# Altium schematic sheet DXES101B-659637-GENERAL.SchDoc
size A3; Organization: Altium Limited; Address1: 3 Minna Close; Address2: Belrose; Address3: NSW 2085; Address4: Australia; SheetNumber: 1; SheetTotal: 10
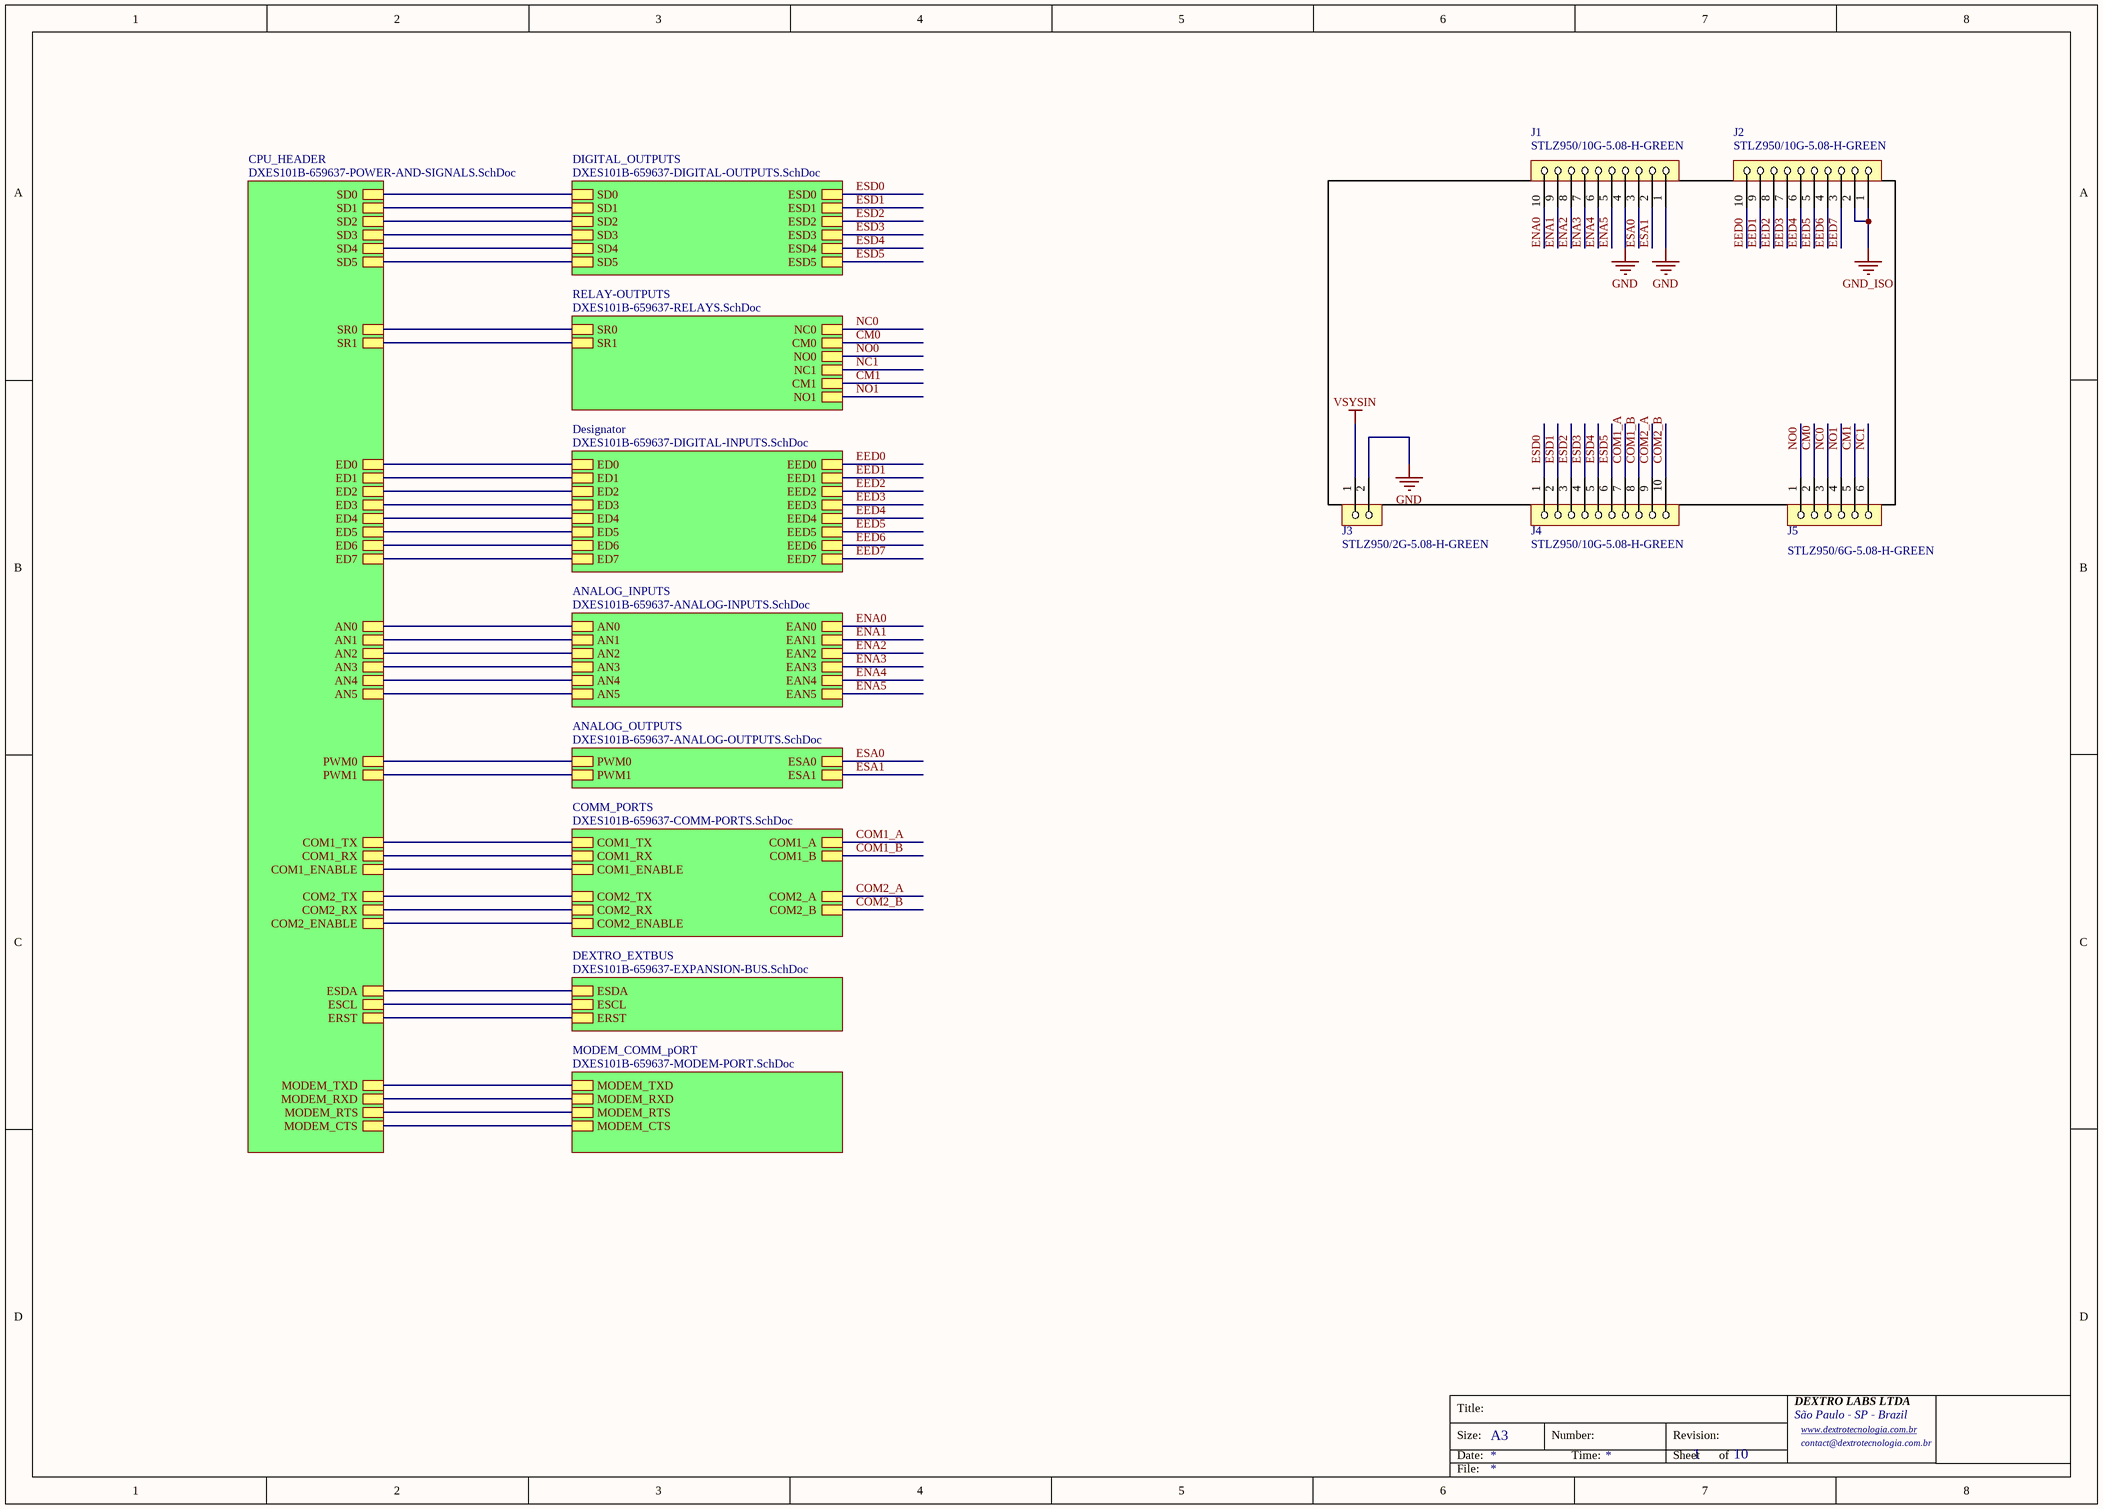
[diagram p0: DXES101B-659637-GENERAL.SchDoc]

## Parts
J1  STLZ950/10G-5.08-H-GREEN  [STLZ950-10G-H]
J2  STLZ950/10G-5.08-H-GREEN  [STLZ950-10G-H]
J3  STLZ950/2G-5.08-H-GREEN  [STLZ950-02G-H]
J4  STLZ950/10G-5.08-H-GREEN  [STLZ950-10G-H]
J5  STLZ950/6G-5.08-H-GREEN  [STLZ950-06G-H]

## Sub-sheets
ANALOG_INPUTS = DXES101B-659637-ANALOG-INPUTS.SchDoc: AN0, AN1, AN2, AN3, EAN0, EAN1, EAN2, EAN3, EAN4, EAN5, AN4, AN5
ANALOG_OUTPUTS = DXES101B-659637-ANALOG-OUTPUTS.SchDoc: PWM0, PWM1, ESA0, ESA1
COMM_PORTS = DXES101B-659637-COMM-PORTS.SchDoc: COM1_TX, COM1_RX, COM1_ENABLE, COM2_TX, COM2_RX, COM2_ENABLE, COM1_A, COM1_B, COM2_A, COM2_B
CPU_HEADER = DXES101B-659637-POWER-AND-SIGNALS.SchDoc: SD0, SD1, SD2, SD3, SD4, SD5, SR0, SR1, ED0, ED1, ED2, ED3, ED4, ED5, ED6, ED7, AN0, AN1, AN2, AN3, PWM0, PWM1, COM1_TX, COM1_RX, COM1_ENABLE, COM2_TX, COM2_RX, COM2_ENABLE, ESDA, ESCL, ERST, MODEM_TXD, MODEM_RXD, MODEM_RTS, MODEM_CTS, AN4, AN5
Designator = DXES101B-659637-DIGITAL-INPUTS.SchDoc: ED0, ED1, ED2, ED3, ED4, ED5, ED6, ED7, EED0, EED1, EED2, EED3, EED4, EED6, EED5, EED7
DEXTRO_EXTBUS = DXES101B-659637-EXPANSION-BUS.SchDoc: ESDA, ESCL, ERST
DIGITAL_OUTPUTS = DXES101B-659637-DIGITAL-OUTPUTS.SchDoc: SD0, SD1, SD2, SD3, SD4, SD5, ESD0, ESD1, ESD2, ESD3, ESD4, ESD5
MODEM_COMM_pORT = DXES101B-659637-MODEM-PORT.SchDoc: MODEM_TXD, MODEM_RXD, MODEM_RTS, MODEM_CTS
RELAY-OUTPUTS = DXES101B-659637-RELAYS.SchDoc: SR0, SR1, NC0, CM0, NO0, NC1, CM1, NO1

## Nets
GND: J1.1 J1.4 J3.2
GND_ISO: J2.1 J2.2
VSYSIN: J3.1
CM0: J5.2 ; sheet RELAY-OUTPUTS/CM0
CM1: J5.5 ; sheet RELAY-OUTPUTS/CM1
COM1_A: J4.7 ; sheet COMM_PORTS/COM1_A
COM1_B: J4.8 ; sheet COMM_PORTS/COM1_B
COM2_A: J4.9 ; sheet COMM_PORTS/COM2_A
COM2_B: J4.10 ; sheet COMM_PORTS/COM2_B
EED0: J2.10 ; sheet Designator/EED0
EED1: J2.9 ; sheet Designator/EED1
EED2: J2.8 ; sheet Designator/EED2
EED3: J2.7 ; sheet Designator/EED3
EED4: J2.6 ; sheet Designator/EED4
EED5: J2.5 ; sheet Designator/EED5
EED6: J2.4 ; sheet Designator/EED6
EED7: J2.3 ; sheet Designator/EED7
ENA0: J1.10 ; sheet ANALOG_INPUTS/EAN0
ENA1: J1.9 ; sheet ANALOG_INPUTS/EAN1
ENA2: J1.8 ; sheet ANALOG_INPUTS/EAN2
ENA3: J1.7 ; sheet ANALOG_INPUTS/EAN3
ENA4: J1.6 ; sheet ANALOG_INPUTS/EAN4
ENA5: J1.5 ; sheet ANALOG_INPUTS/EAN5
ESA0: J1.3 ; sheet ANALOG_OUTPUTS/ESA0
ESA1: J1.2 ; sheet ANALOG_OUTPUTS/ESA1
ESD0: J4.1 ; sheet DIGITAL_OUTPUTS/ESD0
ESD1: J4.2 ; sheet DIGITAL_OUTPUTS/ESD1
ESD2: J4.3 ; sheet DIGITAL_OUTPUTS/ESD2
ESD3: J4.4 ; sheet DIGITAL_OUTPUTS/ESD3
ESD4: J4.5 ; sheet DIGITAL_OUTPUTS/ESD4
ESD5: J4.6 ; sheet DIGITAL_OUTPUTS/ESD5
NC0: J5.3 ; sheet RELAY-OUTPUTS/NC0
NC1: J5.6 ; sheet RELAY-OUTPUTS/NC1
NO0: J5.1 ; sheet RELAY-OUTPUTS/NO0
NO1: J5.4 ; sheet RELAY-OUTPUTS/NO1
(unnamed): sheet CPU_HEADER/SD0, sheet DIGITAL_OUTPUTS/SD0
(unnamed): sheet CPU_HEADER/SD1, sheet DIGITAL_OUTPUTS/SD1
(unnamed): sheet CPU_HEADER/SD2, sheet DIGITAL_OUTPUTS/SD2
(unnamed): sheet CPU_HEADER/SD3, sheet DIGITAL_OUTPUTS/SD3
(unnamed): sheet CPU_HEADER/SD4, sheet DIGITAL_OUTPUTS/SD4
(unnamed): sheet CPU_HEADER/SD5, sheet DIGITAL_OUTPUTS/SD5
(unnamed): sheet CPU_HEADER/SR0, sheet RELAY-OUTPUTS/SR0
(unnamed): sheet CPU_HEADER/SR1, sheet RELAY-OUTPUTS/SR1
(unnamed): sheet CPU_HEADER/ED0, sheet Designator/ED0
(unnamed): sheet CPU_HEADER/ED1, sheet Designator/ED1
(unnamed): sheet CPU_HEADER/ED2, sheet Designator/ED2
(unnamed): sheet CPU_HEADER/ED3, sheet Designator/ED3
(unnamed): sheet CPU_HEADER/ED4, sheet Designator/ED4
(unnamed): sheet CPU_HEADER/ED5, sheet Designator/ED5
(unnamed): sheet CPU_HEADER/ED6, sheet Designator/ED6
(unnamed): sheet CPU_HEADER/ED7, sheet Designator/ED7
(unnamed): sheet CPU_HEADER/AN0, sheet ANALOG_INPUTS/AN0
(unnamed): sheet CPU_HEADER/AN1, sheet ANALOG_INPUTS/AN1
(unnamed): sheet CPU_HEADER/AN2, sheet ANALOG_INPUTS/AN2
(unnamed): sheet CPU_HEADER/AN3, sheet ANALOG_INPUTS/AN3
(unnamed): sheet CPU_HEADER/PWM0, sheet ANALOG_OUTPUTS/PWM0
(unnamed): sheet CPU_HEADER/PWM1, sheet ANALOG_OUTPUTS/PWM1
(unnamed): sheet CPU_HEADER/COM1_TX, sheet COMM_PORTS/COM1_TX
(unnamed): sheet CPU_HEADER/COM1_RX, sheet COMM_PORTS/COM1_RX
(unnamed): sheet CPU_HEADER/COM1_ENABLE, sheet COMM_PORTS/COM1_ENABLE
(unnamed): sheet CPU_HEADER/COM2_TX, sheet COMM_PORTS/COM2_TX
(unnamed): sheet CPU_HEADER/COM2_RX, sheet COMM_PORTS/COM2_RX
(unnamed): sheet CPU_HEADER/COM2_ENABLE, sheet COMM_PORTS/COM2_ENABLE
(unnamed): sheet CPU_HEADER/ESDA, sheet DEXTRO_EXTBUS/ESDA
(unnamed): sheet CPU_HEADER/ESCL, sheet DEXTRO_EXTBUS/ESCL
(unnamed): sheet CPU_HEADER/ERST, sheet DEXTRO_EXTBUS/ERST
(unnamed): sheet CPU_HEADER/MODEM_TXD, sheet MODEM_COMM_pORT/MODEM_TXD
(unnamed): sheet CPU_HEADER/MODEM_RXD, sheet MODEM_COMM_pORT/MODEM_RXD
(unnamed): sheet CPU_HEADER/MODEM_RTS, sheet MODEM_COMM_pORT/MODEM_RTS
(unnamed): sheet CPU_HEADER/MODEM_CTS, sheet MODEM_COMM_pORT/MODEM_CTS
(unnamed): sheet CPU_HEADER/AN4, sheet ANALOG_INPUTS/AN4
(unnamed): sheet CPU_HEADER/AN5, sheet ANALOG_INPUTS/AN5

## Notes on the sheet
- Title:
- Size:
- Date:
- A3
- Number:
- Time:
- Revision:
- Sheet
- of
- DEXTRO LABS LTDA
- São Paulo - SP - Brazil
- www.dextrotecnologia.com.br <http://www.dextrotecnologia.com.br>
- contact@dextrotecnologia.com.br
- File:

## Library data of the parts
J1 J2 J4 = STLZ950/10G-5.08-H-GREEN: CONECTOR PHOENIX MECANO 10 VIAS PASSO 5,08mm VERDE 90º
J3 = STLZ950/2G-5.08-H-GREEN: CONECTOR PHOENIX MECANO 2 VIAS PASSO 5,08mm VERDE 90º
J5 = STLZ950/6G-5.08-H-GREEN: CONECTOR PHOENIX MECANO 6 VIAS PASSO 5,08mm VERDE 90º